# Altium schematic sheet Fast_Charger_Sec.SchDoc
size A4; DocumentNumber: 5; SheetNumber: 5; SheetTotal: 9
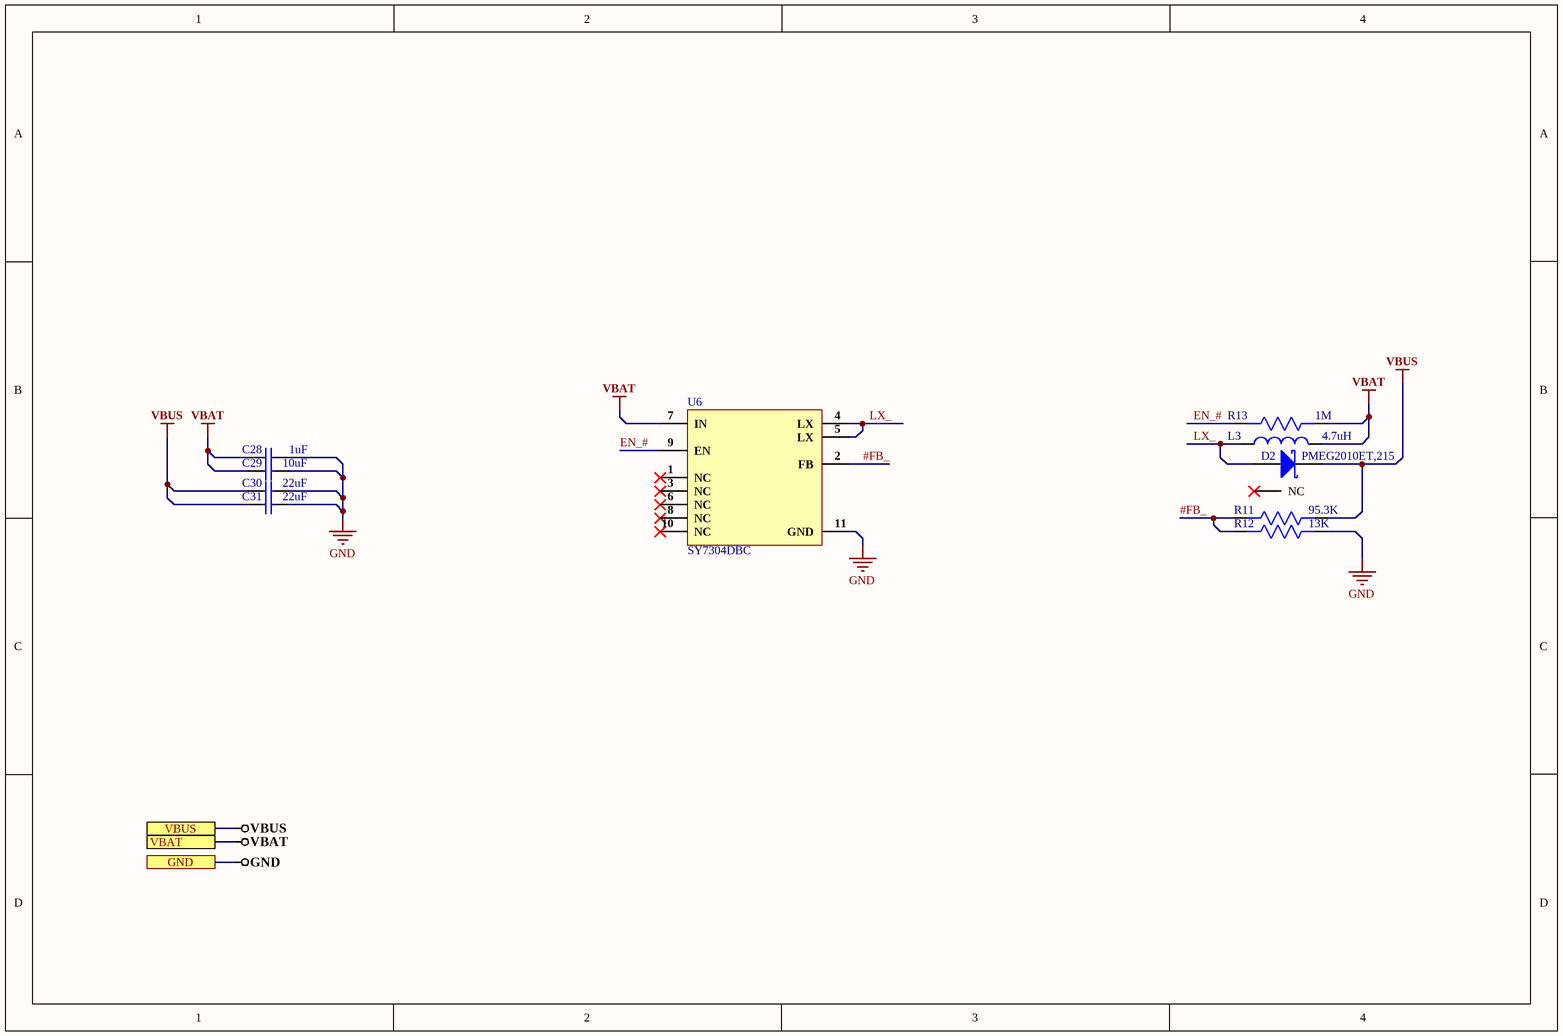
[diagram p0: Fast_Charger_Sec.SchDoc]

## Parts
C28  1uF  [CAP 0201]
C29  10uF  [Cap 0402]
C30  22uF  [Cap0603]
C31  22uF  [Cap0603]
D2  PMEG2010ET,215  [PMEG2010ET,215]
L3  4.7uH  [AMDLA4530Q-4R7MT]
R11  95.3K  [Res-0201]
R12  13K  [Res-0201]
R13  1M  [Res-0201]
U6  SY7304DBC  [DFN-10]

## Ports
GND, VBAT, VBUS

## Nets
GND: C28.2 C29.2 C30.2 C31.2 R12.1 U6.11(GND) ; port GND
VBAT: C28.1 C29.1 L3.2 R13.1 U6.7(IN) ; port VBAT
VBUS: C30.1 C31.1 D2.3 R11.1 ; port VBUS
#FB_: R11.2 R12.2 U6.2(FB)
EN_#: R13.2 U6.9(EN)
LX_: D2.1 L3.1 U6.4(LX) U6.5(LX)

Not connected (* = marked no-connect by the designer): D2 2(NC)*; U6 1(NC)* 3(NC)* 6(NC)* 8(NC)* 10(NC)*

## Library data of the parts
C28 = CL03A105MO3NRNC: Mlcc 0201 X5R1UF16V 20% T: 0.39MM; Manufacturer: Samsung; Supplier 1: Avnet; Manufacturer Part Number: CL03A105MO3NRNC; RoHS: Yes; Category: Ceramic Capacitors; Pricing 1: 100000=0.02840, 120000=0.02800, 220000=0.02720, 500000=0.02660, 1000000=0.02560, 5000000=0.02500, 10000000=0.02440 (USD); RoHS Compliant: Yes; Supplier Part Number 1: CL03A105MO3NRNC
C29 = GRM155R61A106ME44D: 10uF ±20% 10V X5R 0402 Multilayer Ceramic Capacitors MLCC - SMD/SMT RoHS; Manufacturer: Murata Electronics; Package: 0402; Capacitance: 10uF; Tolerance: ±20%; Voltage - Rated: Voltage - Rated; Temperature Coefficient: X5R
C30 C31 = GRT188R61A226ME13D: Cap Ceramic Monolithic 22uF 10VDC 20% SMD Paper T/R; Manufacturer: Murata; Supplier 1: Avnet; Manufacturer Part Number: GRT188R61A226ME13D; RoHS: Yes; Pricing 1: 4000=0.10936, 8000=0.10684, 16000=0.10534, 24000=0.10233, 32000=0.10007 (USD); Supplier Part Number 1: GRT188R61A226ME13D
D2 = PMEG2010ET,215: DIODE SCHOTTKY 20V 1A TO236AB; Manufacturer: NXP Semiconductors; Max Reverse Current: 200uA; Peak Non-Repetitive Surge Current: 9A; Element Configuration: Single; Max Power Dissipation: 420mW; Forward Voltage: 500mV; Supplier 1: Digi-Key; Manufacturer Part Number: PMEG2010ET,215; Stock 1: 13; Pricing 1: 1=0.46, 10=0.376, 100=0.2563, 500=0.1922, 1000=0.14414 (USD); Mount: Surface Mount; Case/Package: TO-236AB; Number of Pins: 3; Min Operating Temperature: -65°C; Max Operating Temperature: 150°C; Forward Current: 1A; Max Repetitive Reverse Voltage (Vrrm): 20V; Package Quantity: 1; Packaging: Tape and Reel; Max Surge Current: 9A; Average Rectified Current: 1A; Max Reverse Leakage Current: 200uA; Max Reverse Voltage (DC): 20V; Series: -; Radiation Hardening: No; RoHS Compliant: Yes; Lead Free: Lead Free; ComponentLink1URL: http://www.nxp.com/documents/data_sheet/PMEG2010EH_EJ_ET.pdf?src-supplier=Digi-Key; ComponentLink1Description: http://www.nxp.com/documents/data_sheet/PMEG2010EH_EJ_ET.pdf?src-supplier=Digi-Key; ComponentLink2URL: http://www.nxp.com/documents/data_sheet/PMEG2010EH_EJ_ET.pdf?ecmp=mouser&src-supplier=Mouser; ComponentLink2Description: http://www.nxp.com/documents/data_sheet/PMEG2010EH_EJ_ET.pdf?ecmp=mouser&src-supplier=Mouser; ComponentLink3URL: http://www.nxp.com/documents/data_sheet/PMEG2010EH_EJ_ET.pdf?src-supplier=Avnet; ComponentLink3Description: http://www.nxp.com/documents/data_sheet/PMEG2010EH_EJ_ET.pdf?src-supplier=Avnet; ComponentLink4URL: http://www.nxp.com/documents/data_sheet/PMEG2010EH_EJ_ET.pdf?src-supplier=Avnet+Europe; ComponentLink4Description: http://www.nxp.com/documents/data_sheet/PMEG2010EH_EJ_ET.pdf?src-supplier=Avnet+Europe; Supplier Part Number 1: 1727-3844-1-ND
L3 = AMDLA4530Q-4R7MT: FIXED IND 4.7UH 5A 52 MOHM SMD; Manufacturer: Abracon; Supplier 1: Digi-Key; Manufacturer Part Number: AMDLA4530Q-4R7MT; Stock 1: 963; Pricing 1: 1=1.08000, 10=1.00500, 25=0.92720, 50=0.77280, 100=0.72640, 250=0.64916, 500=0.55642 (USD); Supplier Part Number 1: 535-AMDLA4530Q-4R7MTCT-ND
R11 = WR02X9532FAL: Res 95.3K Ohm 1% 1/20W 0201; Manufacturer: Walsin Technologies; Supplier 1: Digi-Key; Manufacturer Part Number: WR02X9532FAL; Pricing 1: 15000=0.00247 (USD); Supplier Part Number 1: 1292-WR02X9532FALTR-ND
R12 = 0201WMJ0133TEE: 13kΩ ±5% 1/20W ±200ppm/℃ 0201 Chip Resistor - Surface Mount RoHS; Manufacturer: UNI-ROYAL(Uniroyal Elec); Package: 0201; Resistance: 13kΩ; Tolerance: ±5%; Power(Watts): 1/20W; Temperature Coefficient: ±200ppm/℃; Operating Temperature Range: -
R13 = WR02X105JAL: Res Thick Film 0201 1M Ohm 5% 0.05W(1/20W) ±200ppm/C Molded SMD Paper T/R; Manufacturer: Walsin Technologies; Resistance: 1MR; Supplier 1: Digi-Key; Manufacturer Part Number: WR02X105JAL; RoHS: Yes; Category: Uncategorized; Stock 1: 6920; Pricing 1: 1=0.10000, 10=0.01800, 100=0.00750, 1000=0.00335, 2500=0.00291, 5000=0.00240 (USD); Case/Package: 0201; Min Operating Temperature: -55°C; Max Operating Temperature: 125°C; Resistor Type: Thick Film; Tolerance: 5%; Packaging: Tape and Reel; Length: 0.6mm; Depth: 0.3mm; Military Standard: Not; ComponentLink1URL: http://components.arrow.com/part/dataview/0323_00666329?src-supplier=Arrow+Europe; ComponentLink1Description: http://components.arrow.com/part/dataview/0323_00666329?src-supplier=Arrow+Europe; Supplier Part Number 1: 1292-WR02X105JALCT-ND
U6 = SY7304DBC: 33V 4A DFN-10 DC-DC Converters RoHS; Manufacturer: Silergy Corp; Function: Step-Up; Output Configuration: Positive; Topology: Boost; Output Type: Adjustable; Number of Outputs: 1; Voltage - Input (Min): 3V; Voltage - Output (Min/Fixed): 0.6V; Frequency - Switching: 1MHz; Package: DFN-10; Voltage - Input (Max): 33V; Voltage - Output (Max): 33V; Current - Output: 4A